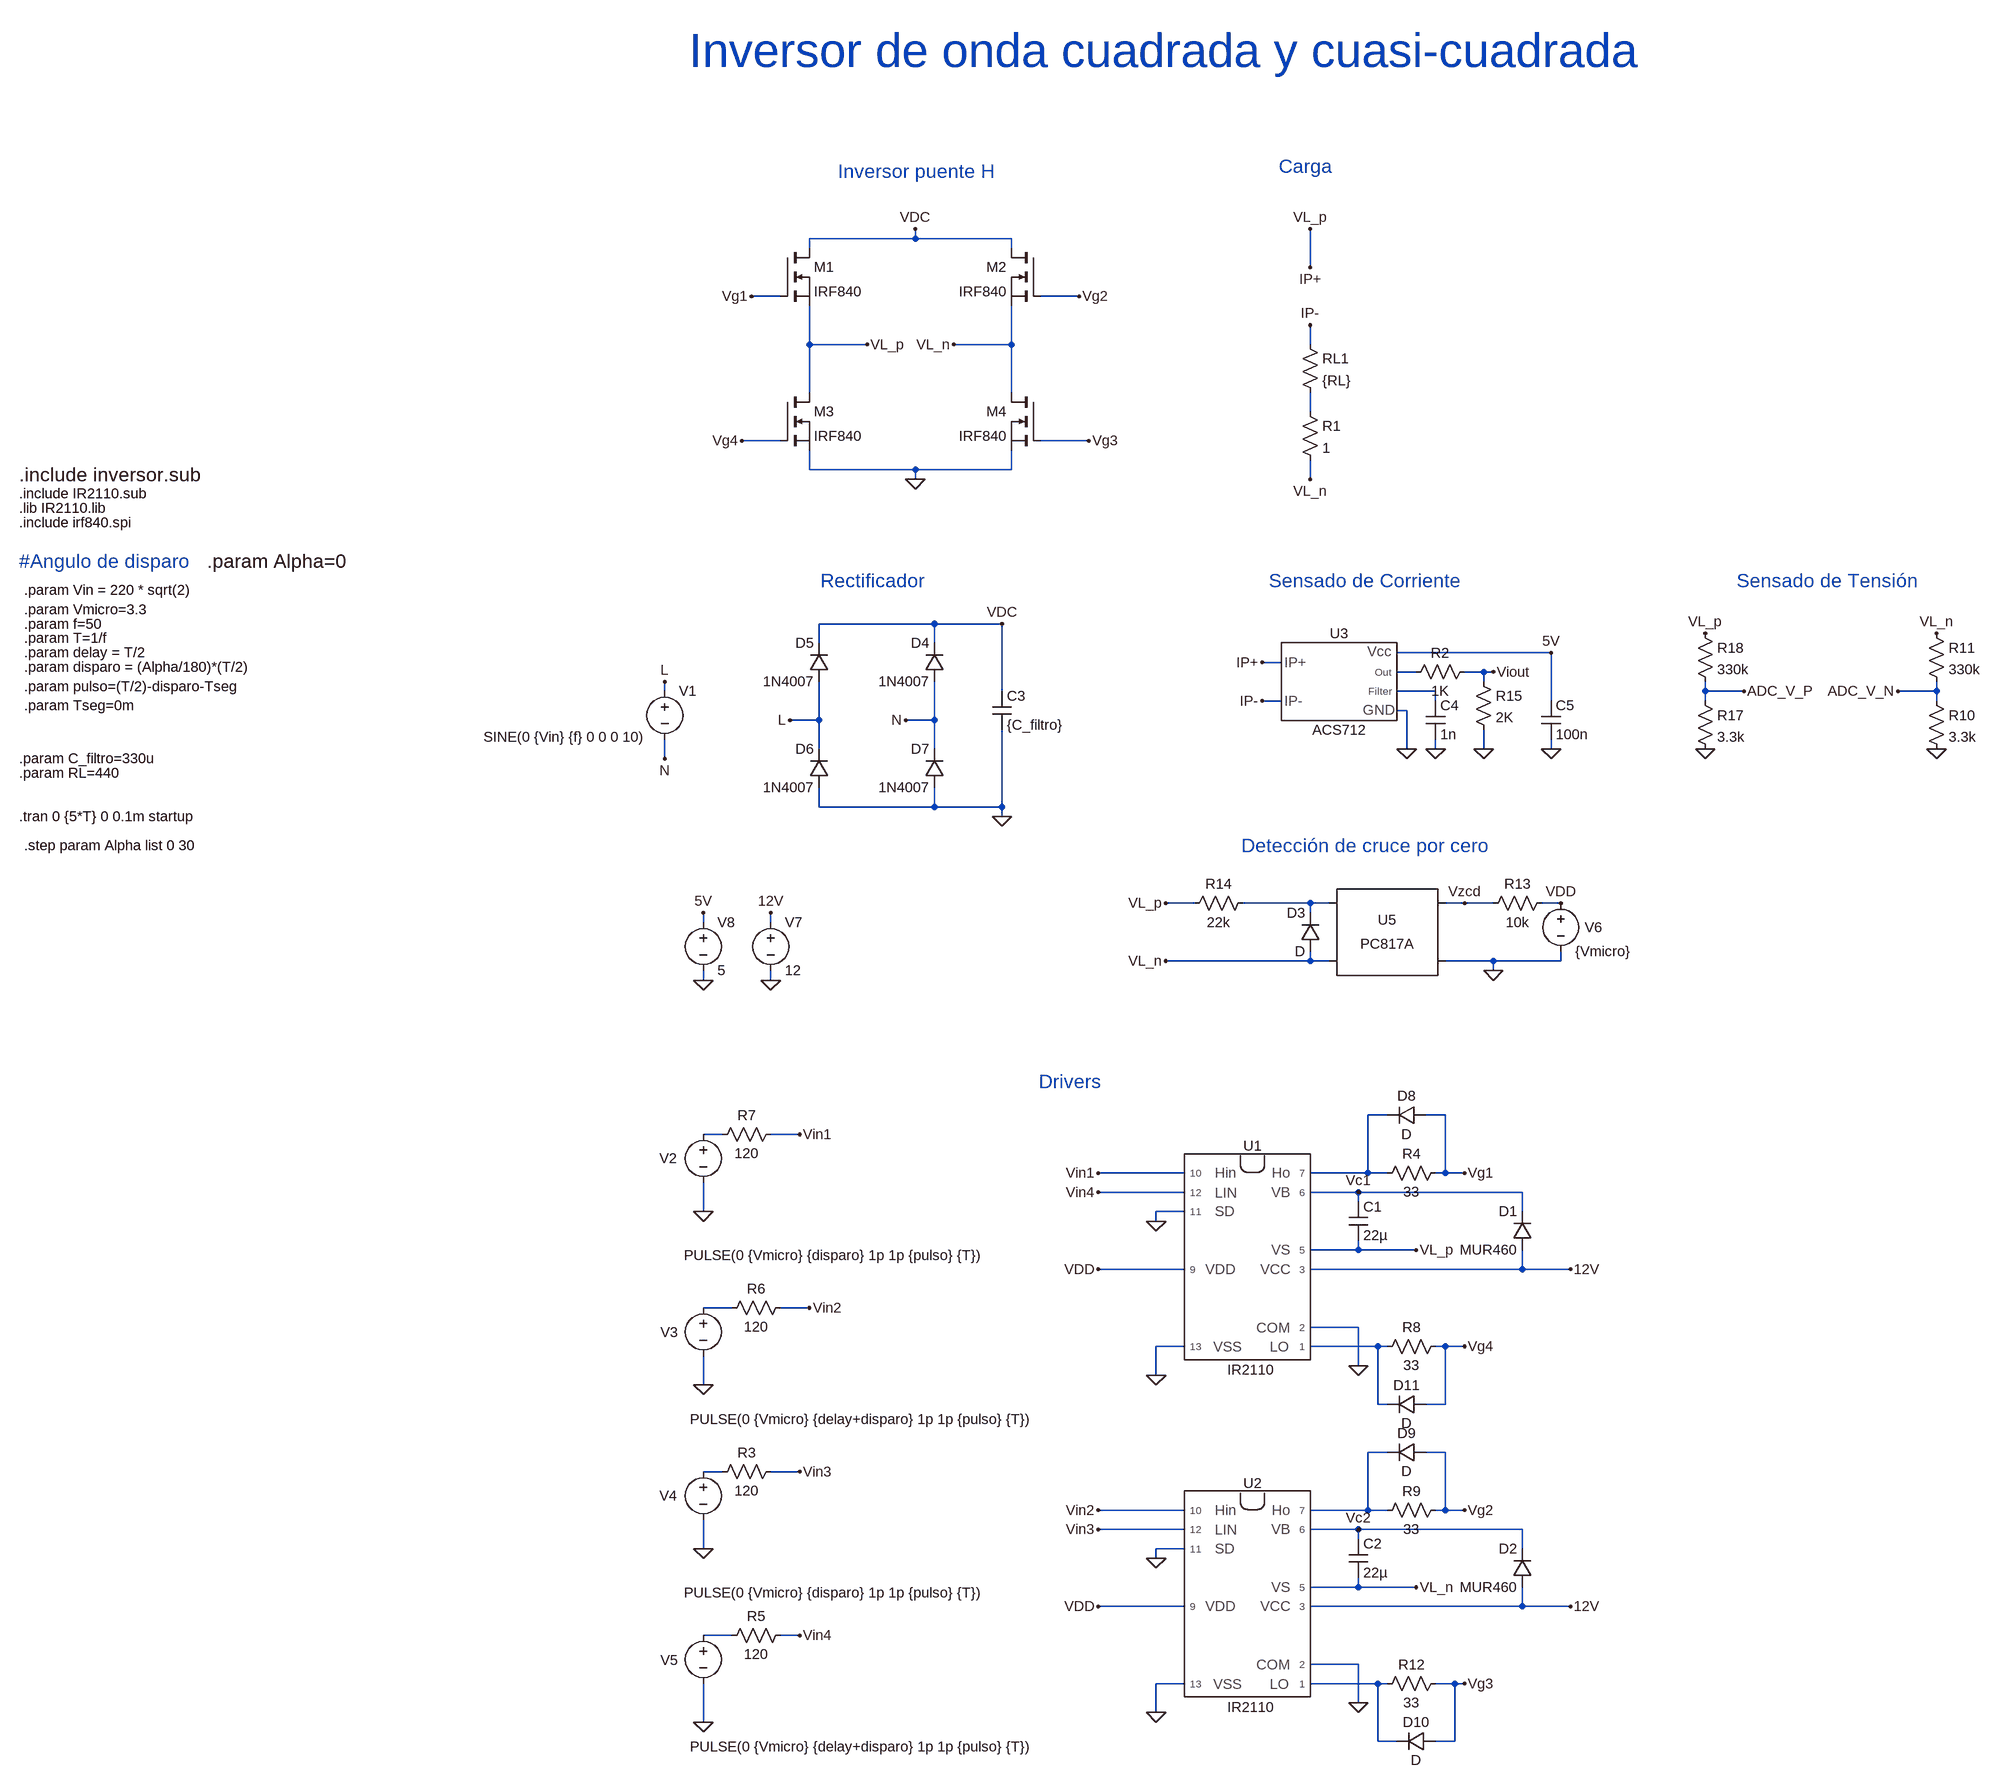
[diagram p0: schematic inversor.asc]
inversor.asc, the LTspice schematic file:
Version 4.1
SHEET 1 6580 1996
WIRE 928 -1488 928 -1504
WIRE 928 -1488 752 -1488
WIRE 1088 -1488 928 -1488
WIRE 752 -1472 752 -1488
WIRE 1088 -1472 1088 -1488
WIRE 1584 -1440 1584 -1504
WIRE 704 -1392 656 -1392
WIRE 1200 -1392 1136 -1392
WIRE 752 -1312 752 -1376
WIRE 848 -1312 752 -1312
WIRE 1088 -1312 1088 -1376
WIRE 1088 -1312 992 -1312
WIRE 1584 -1312 1584 -1344
WIRE 752 -1232 752 -1312
WIRE 1088 -1232 1088 -1312
WIRE 1584 -1200 1584 -1232
WIRE 704 -1152 640 -1152
WIRE 1216 -1152 1136 -1152
WIRE 752 -1104 752 -1136
WIRE 928 -1104 752 -1104
WIRE 1088 -1104 1088 -1136
WIRE 1088 -1104 928 -1104
WIRE 928 -1088 928 -1104
WIRE 1584 -1088 1584 -1120
WIRE 960 -848 768 -848
WIRE 1072 -848 960 -848
WIRE 768 -816 768 -848
WIRE 960 -816 960 -848
WIRE 1984 -800 1728 -800
WIRE 1536 -784 1504 -784
WIRE 1760 -768 1728 -768
WIRE 1872 -768 1840 -768
WIRE 1888 -768 1872 -768
WIRE 1872 -752 1872 -768
WIRE 512 -736 512 -752
WIRE 1072 -736 1072 -848
WIRE 1792 -736 1728 -736
WIRE 2240 -736 2240 -752
WIRE 2304 -736 2240 -736
WIRE 2624 -736 2624 -752
WIRE 2624 -736 2560 -736
WIRE 1536 -720 1504 -720
WIRE 1792 -720 1792 -736
WIRE 1984 -720 1984 -800
WIRE 2240 -720 2240 -736
WIRE 2624 -720 2624 -736
WIRE 1744 -704 1728 -704
WIRE 768 -688 768 -752
WIRE 768 -688 720 -688
WIRE 960 -688 960 -752
WIRE 960 -688 912 -688
WIRE 768 -640 768 -688
WIRE 960 -640 960 -688
WIRE 1744 -640 1744 -704
WIRE 1792 -640 1792 -656
WIRE 1872 -640 1872 -672
WIRE 1984 -640 1984 -656
WIRE 512 -624 512 -656
WIRE 768 -544 768 -576
WIRE 960 -544 960 -576
WIRE 960 -544 768 -544
WIRE 1072 -544 1072 -672
WIRE 1072 -544 960 -544
WIRE 1072 -528 1072 -544
WIRE 1392 -384 1344 -384
WIRE 1584 -384 1472 -384
WIRE 1616 -384 1584 -384
WIRE 1840 -384 1808 -384
WIRE 1888 -384 1840 -384
WIRE 2000 -384 1968 -384
WIRE 1584 -368 1584 -384
WIRE 576 -352 576 -368
WIRE 688 -352 688 -368
WIRE 1584 -288 1584 -304
WIRE 1584 -288 1344 -288
WIRE 1616 -288 1584 -288
WIRE 1888 -288 1808 -288
WIRE 2000 -288 2000 -304
WIRE 2000 -288 1888 -288
WIRE 1888 -272 1888 -288
WIRE 576 -256 576 -272
WIRE 688 -256 688 -272
WIRE 1712 -32 1680 -32
WIRE 1808 -32 1776 -32
WIRE 608 0 576 0
WIRE 736 0 688 0
WIRE 1376 64 1232 64
WIRE 1680 64 1680 -32
WIRE 1680 64 1584 64
WIRE 1712 64 1680 64
WIRE 1808 64 1808 -32
WIRE 1808 64 1792 64
WIRE 1840 64 1808 64
WIRE 1376 96 1232 96
WIRE 1664 96 1584 96
WIRE 1936 96 1664 96
WIRE 1664 112 1664 96
WIRE 576 128 576 80
WIRE 1376 128 1328 128
WIRE 1936 128 1936 96
WIRE 1328 144 1328 128
WIRE 1664 192 1664 176
WIRE 1664 192 1584 192
WIRE 1760 192 1664 192
WIRE 1376 224 1232 224
WIRE 1936 224 1936 192
WIRE 1936 224 1584 224
WIRE 2016 224 1936 224
WIRE 624 288 576 288
WIRE 752 288 704 288
WIRE 1664 320 1584 320
WIRE 1376 352 1328 352
WIRE 1696 352 1584 352
WIRE 1712 352 1696 352
WIRE 1808 352 1792 352
WIRE 1840 352 1808 352
WIRE 1664 384 1664 320
WIRE 1328 400 1328 352
WIRE 576 416 576 368
WIRE 1696 448 1696 352
WIRE 1712 448 1696 448
WIRE 1808 448 1808 352
WIRE 1808 448 1776 448
WIRE 1712 528 1680 528
WIRE 1808 528 1776 528
WIRE 608 560 576 560
WIRE 736 560 688 560
WIRE 1376 624 1232 624
WIRE 1680 624 1680 528
WIRE 1680 624 1584 624
WIRE 1712 624 1680 624
WIRE 1808 624 1808 528
WIRE 1808 624 1792 624
WIRE 1840 624 1808 624
WIRE 1376 656 1232 656
WIRE 1664 656 1584 656
WIRE 1936 656 1664 656
WIRE 1664 672 1664 656
WIRE 576 688 576 640
WIRE 1376 688 1328 688
WIRE 1936 688 1936 656
WIRE 1328 704 1328 688
WIRE 1664 752 1664 736
WIRE 1664 752 1584 752
WIRE 1760 752 1664 752
WIRE 1376 784 1232 784
WIRE 1936 784 1936 752
WIRE 1936 784 1584 784
WIRE 2016 784 1936 784
WIRE 624 832 576 832
WIRE 736 832 704 832
WIRE 1664 880 1584 880
WIRE 1376 912 1328 912
WIRE 1696 912 1584 912
WIRE 1712 912 1696 912
WIRE 1824 912 1792 912
WIRE 1840 912 1824 912
WIRE 1664 944 1664 880
WIRE 1328 960 1328 912
WIRE 576 976 576 912
WIRE 1696 1008 1696 912
WIRE 1728 1008 1696 1008
WIRE 1824 1008 1824 912
WIRE 1824 1008 1792 1008
FLAG 848 -1312 VL_p
FLAG 1888 -272 0
FLAG 1840 -384 Vzcd
FLAG 928 -1088 0
FLAG 576 688 0
FLAG 576 976 0
FLAG 656 -1392 Vg1
FLAG 640 -1152 Vg4
FLAG 992 -1312 VL_n
FLAG 1200 -1392 Vg2
FLAG 1216 -1152 Vg3
FLAG 1664 384 0
FLAG 1328 400 0
FLAG 1232 224 VDD
FLAG 576 128 0
FLAG 576 416 0
FLAG 1840 64 Vg1
FLAG 736 0 Vin1
FLAG 1232 64 Vin1
FLAG 752 288 Vin2
FLAG 736 560 Vin3
FLAG 736 832 Vin4
FLAG 1328 144 0
FLAG 1664 944 0
FLAG 1328 960 0
FLAG 1232 784 VDD
FLAG 1328 704 0
FLAG 1840 624 Vg2
FLAG 1232 624 Vin2
FLAG 1840 352 Vg4
FLAG 1840 912 Vg3
FLAG 1232 656 Vin3
FLAG 1232 96 Vin4
FLAG 1664 96 Vc1
FLAG 1664 656 Vc2
FLAG 1072 -848 VDC
FLAG 1072 -528 0
FLAG 928 -1504 VDC
FLAG 2304 -736 ADC_V_P
FLAG 2560 -736 ADC_V_N
FLAG 512 -752 L
FLAG 720 -688 L
FLAG 512 -624 N
FLAG 912 -688 N
FLAG 1888 -768 Viout
FLAG 1744 -640 0
FLAG 1792 -640 0
FLAG 1984 -640 0
FLAG 1504 -784 IP+
FLAG 1504 -720 IP-
FLAG 1584 -1504 VL_p
FLAG 1584 -1440 IP+
FLAG 1584 -1344 IP-
FLAG 1584 -1088 VL_n
FLAG 2240 -832 VL_p
FLAG 2624 -832 VL_n
FLAG 2240 -640 0
FLAG 2624 -640 0
FLAG 2000 -384 VDD
FLAG 1344 -384 VL_p
FLAG 1760 192 VL_p
FLAG 1344 -288 VL_n
FLAG 1760 752 VL_n
FLAG 576 -256 0
FLAG 576 -368 5V
FLAG 1984 -800 5V
FLAG 2016 224 12V
FLAG 2016 784 12V
FLAG 688 -256 0
FLAG 688 -368 12V
FLAG 1872 -640 0
SYMBOL voltage 576 -16 R0
WINDOW 3 -32 217 Left 2
WINDOW 123 0 0 Left 0
WINDOW 39 0 0 Left 0
WINDOW 0 -73 56 Left 2
SYMATTR Value PULSE(0 {Vmicro} {disparo} 1p 1p {pulso} {T})
SYMATTR InstName V2
SYMBOL voltage 576 272 R0
WINDOW 123 0 0 Left 0
WINDOW 39 0 0 Left 0
WINDOW 3 -22 201 Left 2
WINDOW 0 -71 57 Left 2
SYMATTR Value PULSE(0 {Vmicro} {delay+disparo} 1p 1p {pulso} {T})
SYMATTR InstName V3
SYMBOL Optos\\PC817A 1712 -336 R0
SYMATTR InstName U5
SYMBOL res 720 272 R90
WINDOW 0 0 56 VBottom 2
WINDOW 3 32 56 VTop 2
SYMATTR InstName R6
SYMATTR Value 120
SYMBOL res 704 -16 R90
WINDOW 0 0 56 VBottom 2
WINDOW 3 32 56 VTop 2
SYMATTR InstName R7
SYMATTR Value 120
SYMBOL voltage 576 544 R0
WINDOW 3 -32 217 Left 2
WINDOW 123 0 0 Left 0
WINDOW 39 0 0 Left 0
WINDOW 0 -73 56 Left 2
SYMATTR Value PULSE(0 {Vmicro} {disparo} 1p 1p {pulso} {T})
SYMATTR InstName V4
SYMBOL res 704 544 R90
WINDOW 0 0 56 VBottom 2
WINDOW 3 32 56 VTop 2
SYMATTR InstName R3
SYMATTR Value 120
SYMBOL voltage 576 816 R0
WINDOW 123 0 0 Left 0
WINDOW 39 0 0 Left 0
WINDOW 3 -22 201 Left 2
WINDOW 0 -71 57 Left 2
SYMATTR Value PULSE(0 {Vmicro} {delay+disparo} 1p 1p {pulso} {T})
SYMATTR InstName V5
SYMBOL res 720 816 R90
WINDOW 0 0 56 VBottom 2
WINDOW 3 32 56 VTop 2
SYMATTR InstName R5
SYMATTR Value 120
SYMBOL res 1984 -400 R90
WINDOW 0 0 56 VBottom 2
WINDOW 3 32 56 VTop 2
SYMATTR InstName R13
SYMATTR Value 10k
SYMBOL voltage 2000 -400 R0
WINDOW 123 0 0 Left 0
WINDOW 39 0 0 Left 0
WINDOW 0 40 56 Left 2
SYMATTR InstName V6
SYMATTR Value {Vmicro}
SYMBOL res 1488 -400 R90
WINDOW 0 0 56 VBottom 2
WINDOW 3 32 56 VTop 2
SYMATTR InstName R14
SYMATTR Value 22k
SYMBOL diode 1600 -304 R180
WINDOW 0 24 64 Left 2
WINDOW 3 24 0 Left 2
SYMATTR InstName D3
SYMBOL voltage 512 -752 R0
WINDOW 123 0 0 Left 0
WINDOW 39 0 0 Left 0
WINDOW 3 -33 92 Right 2
SYMATTR Value SINE(0 {Vin} {f} 0 0 0 10)
SYMATTR InstName V1
SYMBOL diode 1952 192 R180
WINDOW 0 24 64 Left 2
WINDOW 3 24 0 Left 2
SYMATTR InstName D1
SYMATTR Value MUR460
SYMBOL cap 1648 112 R0
SYMATTR InstName C1
SYMATTR Value 22µ
SYMBOL res 1808 48 R90
WINDOW 0 0 56 VBottom 2
WINDOW 3 32 56 VTop 2
SYMATTR InstName R4
SYMATTR Value 33
SYMBOL res 1696 368 R270
WINDOW 0 32 56 VTop 2
WINDOW 3 0 56 VBottom 2
SYMATTR InstName R8
SYMATTR Value 33
SYMBOL diode 1952 752 R180
WINDOW 0 24 64 Left 2
WINDOW 3 24 0 Left 2
SYMATTR InstName D2
SYMATTR Value MUR460
SYMBOL cap 1648 672 R0
SYMATTR InstName C2
SYMATTR Value 22µ
SYMBOL res 1808 608 R90
WINDOW 0 0 56 VBottom 2
WINDOW 3 32 56 VTop 2
SYMATTR InstName R9
SYMATTR Value 33
SYMBOL res 1696 928 R270
WINDOW 0 32 56 VTop 2
WINDOW 3 0 56 VBottom 2
SYMATTR InstName R12
SYMATTR Value 33
SYMBOL IR2110 1472 208 R0
SYMATTR InstName U1
SYMBOL IR2110 1472 768 R0
SYMATTR InstName U2
SYMBOL diode 784 -752 R180
WINDOW 0 24 64 Left 2
WINDOW 3 24 0 Left 2
SYMATTR InstName D5
SYMATTR Value 1N4007
SYMBOL cap 1056 -736 R0
SYMATTR InstName C3
SYMATTR Value {C_filtro}
SYMBOL diode 976 -752 R180
WINDOW 0 24 64 Left 2
WINDOW 3 24 0 Left 2
SYMATTR InstName D4
SYMATTR Value 1N4007
SYMBOL diode 784 -576 R180
WINDOW 0 24 64 Left 2
WINDOW 3 24 0 Left 2
SYMATTR InstName D6
SYMATTR Value 1N4007
SYMBOL diode 976 -576 R180
WINDOW 0 24 64 Left 2
WINDOW 3 24 0 Left 2
SYMATTR InstName D7
SYMATTR Value 1N4007
SYMBOL nmos 704 -1472 R0
SYMATTR InstName M1
SYMATTR Value IRF840
SYMATTR Prefix X
SYMBOL nmos 1136 -1472 M0
SYMATTR InstName M2
SYMATTR Value IRF840
SYMATTR Prefix X
SYMBOL nmos 704 -1232 R0
SYMATTR InstName M3
SYMATTR Value IRF840
SYMATTR Prefix X
SYMBOL nmos 1136 -1232 M0
SYMATTR InstName M4
SYMATTR Value IRF840
SYMATTR Prefix X
SYMBOL res 2224 -736 R0
SYMATTR InstName R17
SYMATTR Value 3.3k
SYMBOL res 2224 -848 R0
SYMATTR InstName R18
SYMATTR Value 330k
SYMBOL res 2608 -736 R0
SYMATTR InstName R10
SYMATTR Value 3.3k
SYMBOL res 2608 -848 R0
SYMATTR InstName R11
SYMATTR Value 330k
SYMBOL ACS712 1632 -752 R0
SYMATTR InstName U3
SYMBOL cap 1776 -720 R0
SYMATTR InstName C4
SYMATTR Value 1n
SYMBOL cap 1968 -720 R0
SYMATTR InstName C5
SYMATTR Value 100n
SYMBOL res 1568 -1328 R0
SYMATTR InstName RL1
SYMATTR Value {RL}
SYMBOL res 1568 -1216 R0
SYMATTR InstName R1
SYMATTR Value 1
SYMBOL voltage 576 -368 R0
WINDOW 123 0 0 Left 0
WINDOW 39 0 0 Left 0
SYMATTR InstName V8
SYMATTR Value 5
SYMBOL voltage 688 -368 R0
WINDOW 123 0 0 Left 0
WINDOW 39 0 0 Left 0
SYMATTR InstName V7
SYMATTR Value 12
SYMBOL diode 1776 -48 R90
WINDOW 0 0 32 VBottom 2
WINDOW 3 32 32 VTop 2
SYMATTR InstName D8
SYMBOL diode 1776 512 R90
WINDOW 0 0 32 VBottom 2
WINDOW 3 32 32 VTop 2
SYMATTR InstName D9
SYMBOL res 1856 -784 R90
WINDOW 0 0 56 VBottom 2
WINDOW 3 32 56 VTop 2
SYMATTR InstName R2
SYMATTR Value 1K
SYMBOL res 1856 -768 R0
SYMATTR InstName R15
SYMATTR Value 2K
SYMBOL diode 1792 992 R90
WINDOW 0 0 32 VBottom 2
WINDOW 3 32 32 VTop 2
SYMATTR InstName D10
SYMBOL diode 1776 432 R90
WINDOW 0 0 32 VBottom 2
WINDOW 3 32 32 VTop 2
SYMATTR InstName D11
TEXT -560 -528 Left 2 !.tran 0 {5*T} 0 0.1m startup
TEXT -552 -848 Left 2 !.param f=50
TEXT -552 -824 Left 2 !.param T=1/f
TEXT -552 -744 Left 2 !.param pulso=(T/2)-disparo-Tseg
TEXT -552 -904 Left 2 !.param Vin = 220 * sqrt(2)
TEXT -552 -800 Left 2 !.param delay = T/2
TEXT -552 -872 Left 2 !.param Vmicro=3.3
TEXT -248 -952 Left 3 !.param Alpha=0
TEXT -552 -776 Left 2 !.param disparo = (Alpha/180)*(T/2)
TEXT -560 -600 Left 2 !.param RL=440
TEXT -560 -952 Left 3 ;#Angulo de disparo
TEXT -560 -1096 Left 3 !.include inversor.sub
TEXT 552 -1800 Left 6 ;Inversor de onda cuadrada y cuasi-cuadrada
TEXT -552 -712 Left 2 !.param Tseg=0m
TEXT -560 -1064 Left 2 !.include IR2110.sub
TEXT -560 -1040 Left 2 !.lib IR2110.lib
TEXT -560 -624 Left 2 !.param C_filtro=330u
TEXT -560 -1016 Left 2 !.include irf840.spi
TEXT 856 -920 Center 3 ;Rectificador
TEXT 928 -1600 Center 3 ;Inversor puente H
TEXT 1576 -1608 Center 3 ;Carga
TEXT 2440 -920 Center 3 ;Sensado de Tensión
TEXT 1672 -920 Center 3 ;Sensado de Corriente
TEXT 1672 -480 Center 3 ;Detección de cruce por cero
TEXT 1184 -88 Center 3 ;Drivers
TEXT -552 -480 Left 2 !.step param Alpha list 0 30

The netlist it stands for:
* inversor.asc
V2 N006 0 PULSE(0 {Vmicro} {disparo} 1p 1p {pulso} {T})
V3 N007 0 PULSE(0 {Vmicro} {delay+disparo} 1p 1p {pulso} {T})
X§U5 N004 VL_n Vzcd 0 PC817 Igain=1m
R6 Vin2 N007 120
R7 Vin1 N006 120
V4 N010 0 PULSE(0 {Vmicro} {disparo} 1p 1p {pulso} {T})
R3 Vin3 N010 120
V5 N011 0 PULSE(0 {Vmicro} {delay+disparo} 1p 1p {pulso} {T})
R5 Vin4 N011 120
R13 VDD Vzcd 10k
V6 VDD 0 {Vmicro}
R14 N004 IP+ 22k
D3 VL_n N004 D
V1 L N SINE(0 {Vin} {f} 0 0 0 10)
D1 12V Vc1 MUR460
C1 Vc1 IP+ 22µ
R4 Vg1 N005 33
R8 N008 Vg4 33
D2 12V Vc2 MUR460
C2 Vc2 VL_n 22µ
R9 Vg2 N009 33
R12 N012 Vg3 33
X§U1 VDD Vin1 0 Vin4 0 N005 Vc1 IP+ 12V 0 N008 IR2110  ; pins 9 10 11 12 13 7 6 5 3 2 1
X§U2 VDD Vin2 0 Vin3 0 N009 Vc2 VL_n 12V 0 N012 IR2110  ; pins 9 10 11 12 13 7 6 5 3 2 1
D5 L VDC 1N4007
C3 VDC 0 {C_filtro}
D4 N VDC 1N4007
D6 0 L 1N4007
D7 0 N 1N4007
X§M1 VDC Vg1 IP+ IRF840  ; pins D G S
X§M2 VDC Vg2 VL_n IRF840  ; pins D G S
X§M3 IP+ Vg4 0 IRF840  ; pins D G S
X§M4 VL_n Vg3 0 IRF840  ; pins D G S
R17 ADC_V_P 0 3.3k
R18 IP+ ADC_V_P 330k
R10 ADC_V_N 0 3.3k
R11 VL_n ADC_V_N 330k
X§U3 IP+ IP- N003 N002 5V 0 ACS712  ; pins I+ I- Filter Out V+ V-
C4 N003 0 1n
C5 5V 0 100n
RL1 IP- N001 {RL}
R1 N001 VL_n 1
V8 5V 0 5
V7 12V 0 12
D8 Vg1 N005 D
D9 Vg2 N009 D
R2 Viout N002 1K
R15 Viout 0 2K
D10 Vg3 N012 D
D11 Vg4 N008 D
.model D D
.lib standard.dio
.tran 0 {5*T} 0 0.1m startup
.param f=50
.param T=1/f
.param pulso=(T/2)-disparo-Tseg
.param Vin = 220 * sqrt(2)
.param delay = T/2
.param Vmicro=3.3
.param Alpha=0
.param disparo = (Alpha/180)*(T/2)
.param RL=440
* #Angulo de disparo
.include inversor.sub
* Inversor de onda cuadrada y cuasi-cuadrada
.param Tseg=0m
.include IR2110.sub
.lib IR2110.lib
.param C_filtro=330u
.include irf840.spi
* Rectificador
* Inversor puente H
* Carga
* Sensado de Tensión
* Sensado de Corriente
* Detección de cruce por cero
* Drivers
.step param Alpha list 0 30
.lib PC817.sub
.lib IR2110.sub
.lib ACS712.lib
.backanno
.end